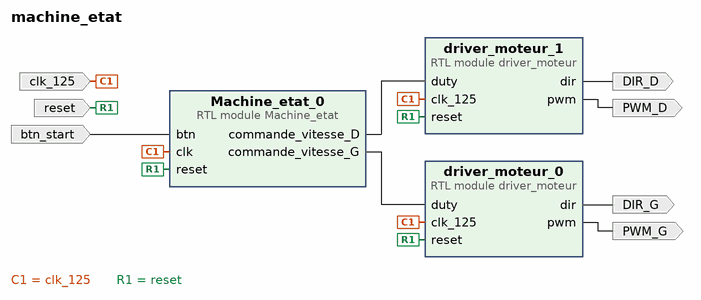
[diagram p0: block diagram of the top level]
# Vivado block design machine_etat, xc7z020clg400-1, Vivado 2020.2
create_bd_design machine_etat

create_bd_port -dir I clk_125
create_bd_port -dir I reset
create_bd_port -dir O PWM_D
create_bd_port -dir O DIR_D
create_bd_port -dir O PWM_G
create_bd_port -dir O DIR_G
create_bd_port -dir I btn_start

create_bd_cell -type module -reference Machine_etat Machine_etat_0
create_bd_cell -type module -reference driver_moteur driver_moteur_0
create_bd_cell -type module -reference driver_moteur driver_moteur_1

# ---- connections ----

connect_bd_net [get_bd_pins Machine_etat_0/commande_vitesse_G] [get_bd_pins driver_moteur_0/duty]
connect_bd_net [get_bd_pins Machine_etat_0/commande_vitesse_D] [get_bd_pins driver_moteur_1/duty]
connect_bd_net -net clk_125_1 [get_bd_ports clk_125] \
  [get_bd_pins Machine_etat_0/clk] [get_bd_pins driver_moteur_0/clk_125] [get_bd_pins driver_moteur_1/clk_125]
connect_bd_net [get_bd_ports reset] [get_bd_pins Machine_etat_0/reset] [get_bd_pins driver_moteur_0/reset] [get_bd_pins driver_moteur_1/reset]
connect_bd_net [get_bd_pins driver_moteur_1/pwm] [get_bd_ports PWM_D]
connect_bd_net [get_bd_pins driver_moteur_0/dir] [get_bd_ports DIR_G]
connect_bd_net [get_bd_pins driver_moteur_0/pwm] [get_bd_ports PWM_G]
connect_bd_net [get_bd_pins driver_moteur_1/dir] [get_bd_ports DIR_D]
connect_bd_net [get_bd_ports btn_start] [get_bd_pins Machine_etat_0/btn]

validate_bd_design
save_bd_design
